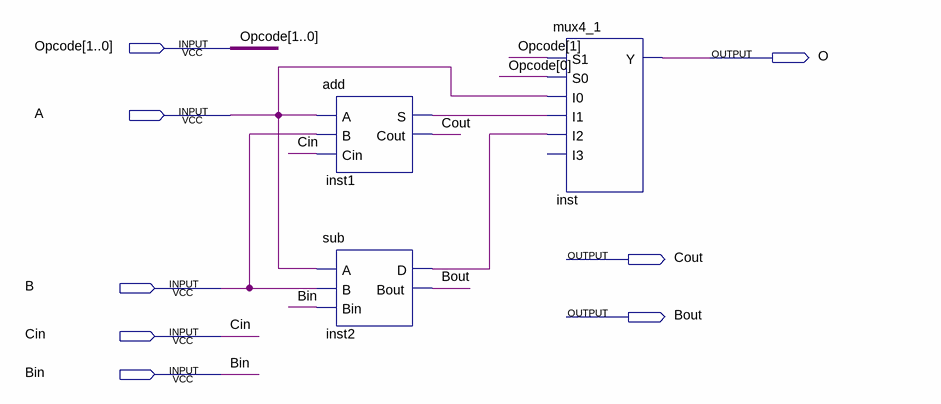
[diagram p0: schematic sheet]
// Quartus schematic ALU.bdf as structural Verilog: 3 symbols, 8 pins
module ALU (
  input  [1:0] Opcode,
  input  A,
  input  B,
  input  Cin,
  input  Bin,
  output O,
  output Cout,
  output Bout
);

  wire inst1_s, inst2_d;

  add inst1 (.A(A), .B(B), .Cin(Cin), .S(inst1_s), .Cout(Cout));
  sub inst2 (.A(A), .B(B), .Bin(Bin), .D(inst2_d), .Bout(Bout));
  mux4_1 inst (.S1(Opcode[1]), .S0(Opcode[0]), .I0(A), .I1(inst1_s), .I2(inst2_d), .Y(O));  // open: I3
endmodule
